# Altium schematic sheet Main.SchDoc
size B; SheetNumber: 1; SheetTotal: 7
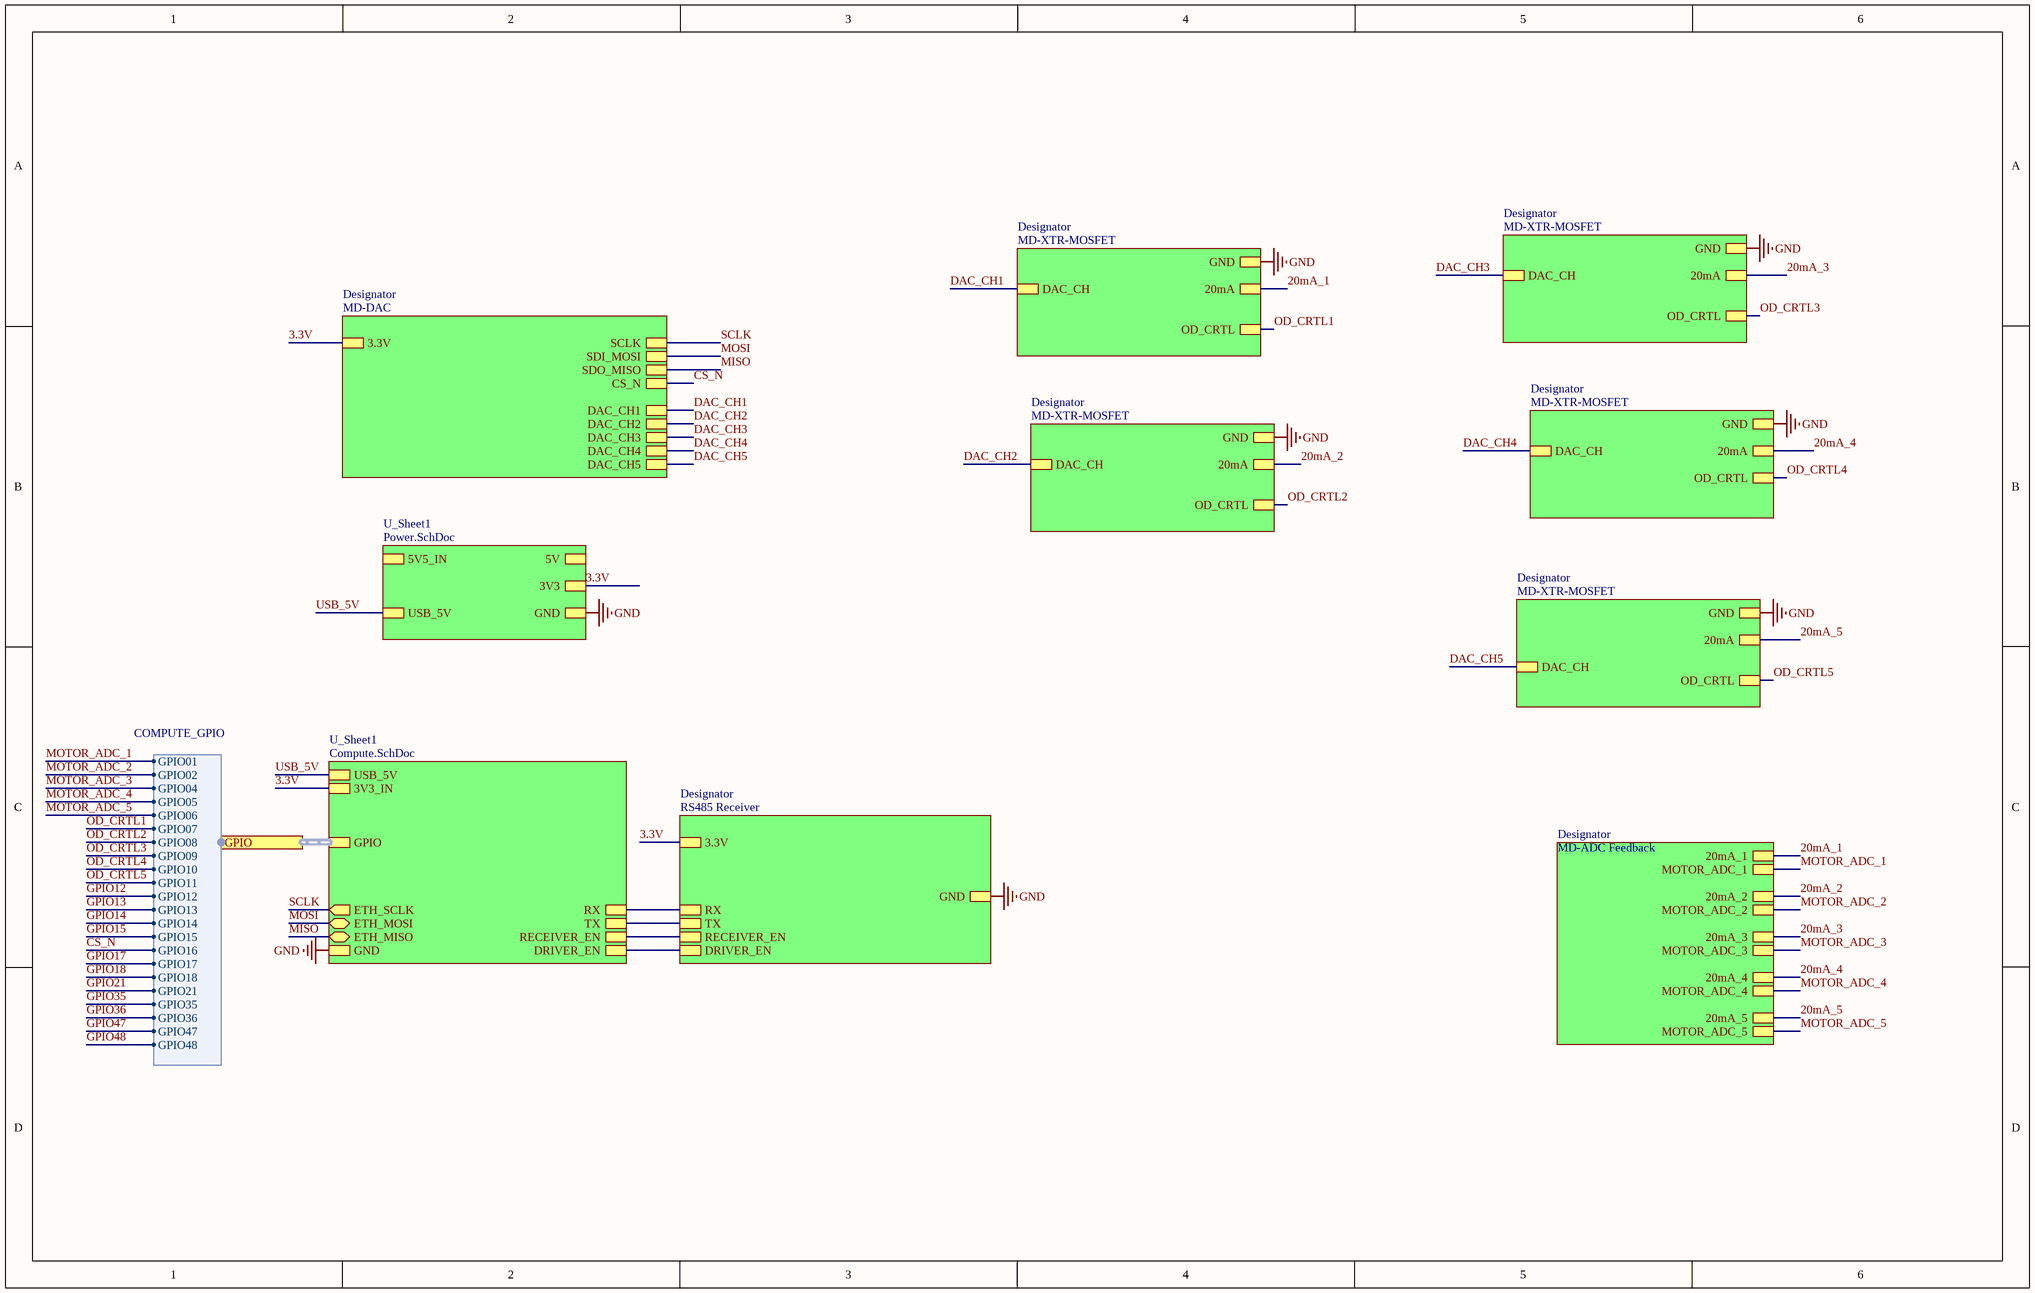
[diagram p0: Main.SchDoc]

## Sub-sheets
Designator = RS485 Receiver: 3.3V, GND, DRIVER_EN, RECEIVER_EN, TX, RX
Designator = MD-DAC: 3.3V, DAC_CH1, DAC_CH2, DAC_CH3, DAC_CH4, DAC_CH5, SCLK, SDI_MOSI, SDO_MISO, CS_N
Designator = MD-XTR-MOSFET: DAC_CH, OD_CRTL, GND, 20mA
Designator = MD-ADC Feedback: MOTOR_ADC_5, 20mA_5, MOTOR_ADC_4, 20mA_4, MOTOR_ADC_3, 20mA_3, MOTOR_ADC_2, 20mA_2, MOTOR_ADC_1, 20mA_1
Designator = MD-XTR-MOSFET: DAC_CH, OD_CRTL, GND, 20mA
Designator = MD-XTR-MOSFET: DAC_CH, OD_CRTL, GND, 20mA
Designator = MD-XTR-MOSFET: DAC_CH, OD_CRTL, 20mA, GND
Designator = MD-XTR-MOSFET: DAC_CH, OD_CRTL, 20mA, GND
U_Sheet1 = Compute.SchDoc: USB_5V, 3V3_IN, DRIVER_EN, RECEIVER_EN, TX, RX, GPIO (harness COMPUTE_GPIO), GND, ETH_MISO (bidir), ETH_MOSI (bidir), ETH_SCLK (out)
U_Sheet1 = Power.SchDoc: GND, 3V3, USB_5V, 5V5_IN, 5V

## Ports
GPIO (harness COMPUTE_GPIO)

## Harnesses
COMPUTE_GPIO: GPIO01, GPIO02, GPIO04, GPIO05, GPIO06, GPIO07, GPIO08, GPIO14, GPIO17, GPIO18, GPIO21, GPIO35, GPIO36, GPIO47, GPIO48, GPIO10, GPIO16, GPIO15, GPIO13, GPIO12, GPIO11, GPIO09

## Nets
GND: sheet Designator/GND, sheet Designator/GND, sheet Designator/GND, sheet Designator/GND, sheet Designator/GND, sheet Designator/GND, sheet U_Sheet1/GND, sheet U_Sheet1/GND
3.3V: sheet Designator/3.3V, sheet Designator/3.3V, sheet U_Sheet1/3V3_IN, sheet U_Sheet1/3V3
20mA_1: sheet Designator/20mA_1, sheet Designator/20mA
20mA_2: sheet Designator/20mA_2, sheet Designator/20mA
20mA_3: sheet Designator/20mA_3, sheet Designator/20mA
20mA_4: sheet Designator/20mA_4, sheet Designator/20mA
20mA_5: sheet Designator/20mA, sheet Designator/20mA_5
CS_N: sheet Designator/CS_N, port GPIO.GPIO16
DAC_CH1: sheet Designator/DAC_CH1, sheet Designator/DAC_CH
DAC_CH2: sheet Designator/DAC_CH2, sheet Designator/DAC_CH
DAC_CH3: sheet Designator/DAC_CH3, sheet Designator/DAC_CH
DAC_CH4: sheet Designator/DAC_CH4, sheet Designator/DAC_CH
DAC_CH5: sheet Designator/DAC_CH5, sheet Designator/DAC_CH
GPIO12: port GPIO.GPIO12
GPIO13: port GPIO.GPIO13
GPIO14: port GPIO.GPIO14
GPIO15: port GPIO.GPIO15
GPIO17: port GPIO.GPIO17
GPIO18: port GPIO.GPIO18
GPIO21: port GPIO.GPIO21
GPIO35: port GPIO.GPIO35
GPIO36: port GPIO.GPIO36
GPIO47: port GPIO.GPIO47
GPIO48: port GPIO.GPIO48
MISO: sheet Designator/SDO_MISO, sheet U_Sheet1/ETH_MISO
MOSI: sheet Designator/SDI_MOSI, sheet U_Sheet1/ETH_MOSI
MOTOR_ADC_1: sheet Designator/MOTOR_ADC_1, port GPIO.GPIO01
MOTOR_ADC_2: sheet Designator/MOTOR_ADC_2, port GPIO.GPIO02
MOTOR_ADC_3: sheet Designator/MOTOR_ADC_3, port GPIO.GPIO04
MOTOR_ADC_4: sheet Designator/MOTOR_ADC_4, port GPIO.GPIO05
MOTOR_ADC_5: sheet Designator/MOTOR_ADC_5, port GPIO.GPIO06
OD_CRTL1: sheet Designator/OD_CRTL, port GPIO.GPIO07
OD_CRTL2: sheet Designator/OD_CRTL, port GPIO.GPIO08
OD_CRTL3: sheet Designator/OD_CRTL, port GPIO.GPIO09
OD_CRTL4: sheet Designator/OD_CRTL, port GPIO.GPIO10
OD_CRTL5: sheet Designator/OD_CRTL, port GPIO.GPIO11
SCLK: sheet Designator/SCLK, sheet U_Sheet1/ETH_SCLK
USB_5V: sheet U_Sheet1/USB_5V, sheet U_Sheet1/USB_5V
(unnamed): sheet Designator/DRIVER_EN, sheet U_Sheet1/DRIVER_EN
(unnamed): sheet Designator/RECEIVER_EN, sheet U_Sheet1/RECEIVER_EN
(unnamed): sheet Designator/TX, sheet U_Sheet1/TX
(unnamed): sheet Designator/RX, sheet U_Sheet1/RX

## Buses and harness runs
harness port GPIO = sheet U_Sheet1/GPIO